# EAGLE design out8_16A_mi_1_0 (EAGLE 5.04)
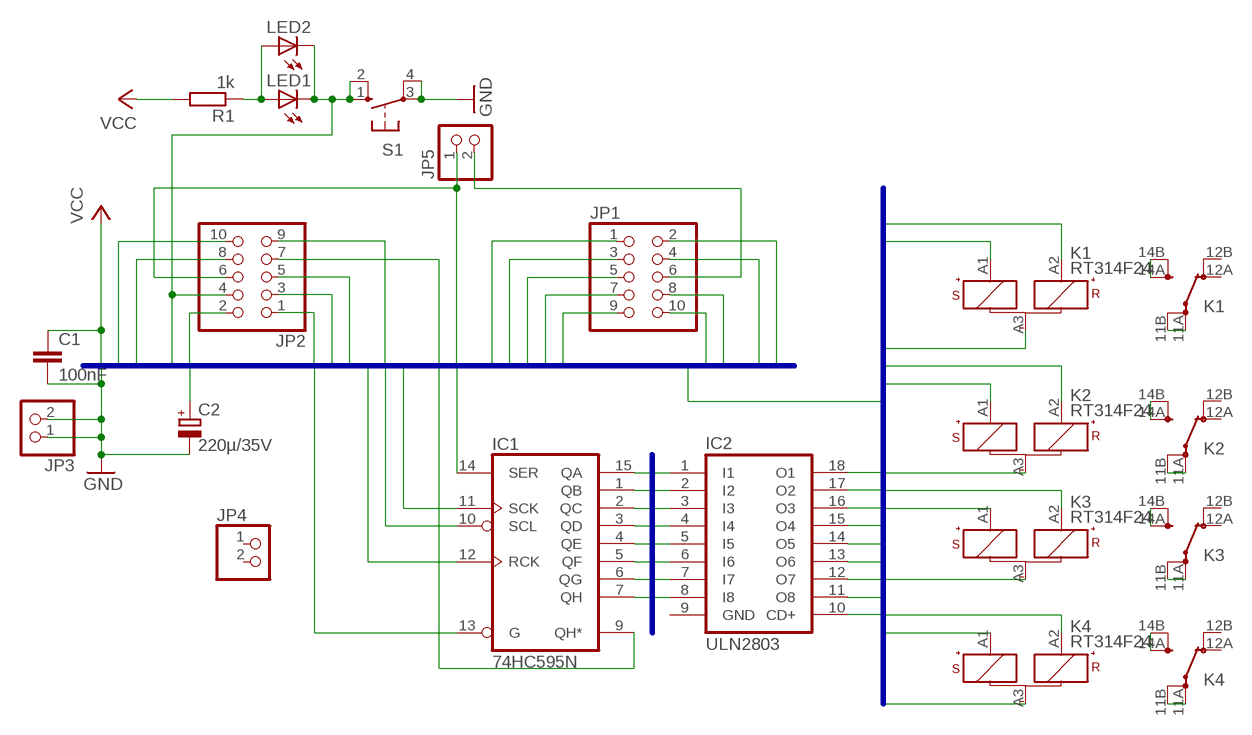
[diagram p0: schematic, sheet 1]

## Parts
C1  100nF  C-EU050-024X044  [C050-024X044]
C2  220µ/35V  CPOL-EUE5-10.5  [E5-10,5]
IC1  74HC595N  [DIL16]
IC2  ULN2803  ULN2803A  [DIL18]
JP1  PINHD-2X5  [2X05]
JP2  PINHD-2X5  [2X05]
JP3  PINHD-1X2  [1X02]
JP4  PINHD-1X2  [1X02]
JP5  PINHD-1X2  [1X02]
K1  RT314F24  [RT1-BI]
K2  RT314F24  [RT1-BI]
K3  RT314F24  [RT1-BI]
K4  RT314F24  [RT1-BI]
LED1  LED3MM  [LED3MM]
LED2  LEDCHIPLED_1206  [CHIPLED_1206]
R1  1k  R-EU_0207/7  [0207/7]
S1  10-XX  [B3F-10XX]

## Nets
CTRL: IC1.13(G) JP1.3 JP2.3
EIB+: JP1.1 JP2.1
GND: C1.2 C2.- JP1.2 JP2.2 JP3.1 JP3.2 S1.3(P) S1.4(P1)
IO0: IC1.14(SER) JP1.7
IO1: JP1.8 JP2.8
IO2: IC1.12(RCK) JP1.9 JP2.9
IO3: IC1.11(SCK) JP1.10 JP2.10
N$1: K1.14A(2:SA) K1.14B(2:SB)
N$2: K1.11A(2:PA) K1.11B(2:PB)
N$11: K2.14A(2:SA) K2.14B(2:SB)
N$12: K2.11A(2:PA) K2.11B(2:PB)
N$18: K3.14A(2:SA) K3.14B(2:SB)
N$19: K3.11A(2:PA) K3.11B(2:PB)
N$20: K4.14A(2:SA) K4.14B(2:SB)
N$21: K4.11A(2:PA) K4.11B(2:PB)
N$30: LED1.A LED2.A R1.1
N$38: IC1.9(QH*) JP2.7
O1: IC2.18(O1) K2.A1(1:S+)
O2: IC2.17(O2) K2.A2(1:R+)
O3: IC2.16(O3) K1.A1(1:S+)
O4: IC2.15(O4) K1.A2(1:R+)
O5: IC2.14(O5) K4.A1(1:S+)
O6: IC2.13(O6) K4.A2(1:R+)
O7: IC2.12(O7) K3.A1(1:S+)
O8: IC2.11(O8) K3.A2(1:R+)
PARSEROUT0: IC1.7(QH) IC2.1(I1)
PARSEROUT1: IC1.6(QG) IC2.2(I2)
PARSEROUT2: IC1.5(QF) IC2.3(I3)
PARSEROUT3: IC1.4(QE) IC2.4(I4)
PARSEROUT4: IC1.3(QD) IC2.5(I5)
PARSEROUT5: IC1.2(QC) IC2.6(I6)
PARSEROUT6: IC1.1(QB) IC2.7(I7)
PARSEROUT7: IC1.15(QA) IC2.8(I8)
PROG: JP1.4 JP2.4 LED1.K(C) LED2.C S1.1(S) S1.2(S1)
VCC: C1.1 IC1.10(SCL) JP1.5 JP2.5 R1.2
VERS: C2.+ IC2.10(CD+) JP2.6 JP5.1 K1.A3(1:-) K2.A3(1:-) K3.A3(1:-) K4.A3(1:-)
VERS_CONTR: JP1.6 JP5.2
Unconnected: JP4.1 JP4.2 K1.12A(2:OA) K1.12B(2:OB) K2.12A(2:OA) K2.12B(2:OB) K3.12A(2:OA) K3.12B(2:OB) K4.12A(2:OA) K4.12B(2:OB)

## Buses
EIB+,GND,CTRL,PROG,VCC,VERS,IO[0..3]
PARSEROUT[0..7]
O[1..8],VERS

## Power pins joined to a net without a drawn wire
GND: IC1.8(GND) IC2.9(GND)
VCC: IC1.16(VCC)

## Library data of the parts
C1 = rcl:C-EU: CAPACITOR, European symbol
C2 = rcl:CPOL-EU: POLARIZED CAPACITOR, European symbol
IC1 = 74xx-eu:74*595: 8-bit SHIFT REGISTER, output latch
IC2 = uln-udn:ULN2803A: DRIVER ARRAY
JP1 JP2 = pinhead:PINHD-2X5: PIN HEADER
JP3-JP5 = pinhead:PINHD-1X2: PIN HEADER
K1-K4 = relay:RT?F*: Power PCB Relay SCHRACK bistable 1 pole 16 A, polarized bistable version Source: http://www.schrack.com/.. 5821.pdf
LED1 LED2 = led:LED: LED OSRAM: - CHIPLED LG R971, LG N971, LY N971, LG Q971, LY Q971, LO R971, LY R971 LH N974, LH R974 LS Q976, LO Q976, LY Q976 LO Q996 - Hyper CHIPLED LW Q18S LB Q993, LB Q99A, LB R99A - SideLED LS A670, LO A670, LY A670, LG A670, LP A670 LB A673, LV A673, LT A673, LW A673 LH A674 LY A675 LS A676, LA A676, LO A676, LY A676, LW A676 LS A679, LY A679, LG A679 - Hyper Micro SIDELED® LS Y876, LA Y876, LO Y876, LY Y876 LT Y87S - SmartLED LW L88C, LW L88S LB L89C, LB L89S, LG L890 LS L89K, LO L89K, LY L89K LS L896, LA L896, LO L896, LY L896 - TOPLED LS T670, LO T670, LY T670, LG T670, LP T670 LSG T670, LSP T670, LSY T670, LOP T670, LYG T670 LG T671, LOG T671, LSG T671 LB T673, LV T673, LT T673, LW T673 LH T674 LS T676, LA T676, LO T676, LY T676, LB T676, LH T676, LSB T676, LW T676 LB T67C, LV T67C, LT T67C, LS T67K, LO T67K, LY T67K, LW E67C LS E67B, LA E67B, LO E67B, LY E67B, LB E67C, LV E67C, LT E67C LW T67C LS T679, LY T679, LG T679 LS T770, LO T770, LY T770, LG T770, LP T770 LB T773, LV T773, LT T773, LW T773 LH T774 LS E675, LA E675, LY E675, LS T675 LS T776, LA T776, LO T776, LY T776, LB T776 LHGB T686 LT T68C, LB T68C - Hyper Mini TOPLED® LB M676 - Mini TOPLED Santana® LG M470 LS M47K, LO M47K, LY M47K Source: http://www.osram.convergy.de - LUMILED® LXK2-PW12-R00, LXK2-PW12-S00, LXK2-PW14-U00, LXK2-PW14-V00 LXK2-PM12-R00, LXK2-PM12-S00, LXK2-PM14-U00 LXK2-PE12-Q00, LXK2-PE12-R00, LXK2-PE12-S00, LXK2-PE14-T00, LXK2-PE14-U00 LXK2-PB12-K00, LXK2-PB12-L00, LXK2-PB12-M00, LXK2-PB14-N00, LXK2-PB14-P00, LXK2-PB14-Q00 LXK2-PR12-L00, LXK2-PR12-M00, LXK2-PR14-Q00, LXK2-PR14-R00 LXK2-PD12-Q00, LXK2-PD12-R00, LXK2-PD12-S00 LXK2-PH12-R00, LXK2-PH12-S00 LXK2-PL12-P00, LXK2-PL12-Q00, LXK2-PL12-R00 Source: www.luxeon.com
R1 = rcl:R-EU_: RESISTOR, European symbol
S1 = switch-omron:10-XX: OMRON SWITCH

## Board
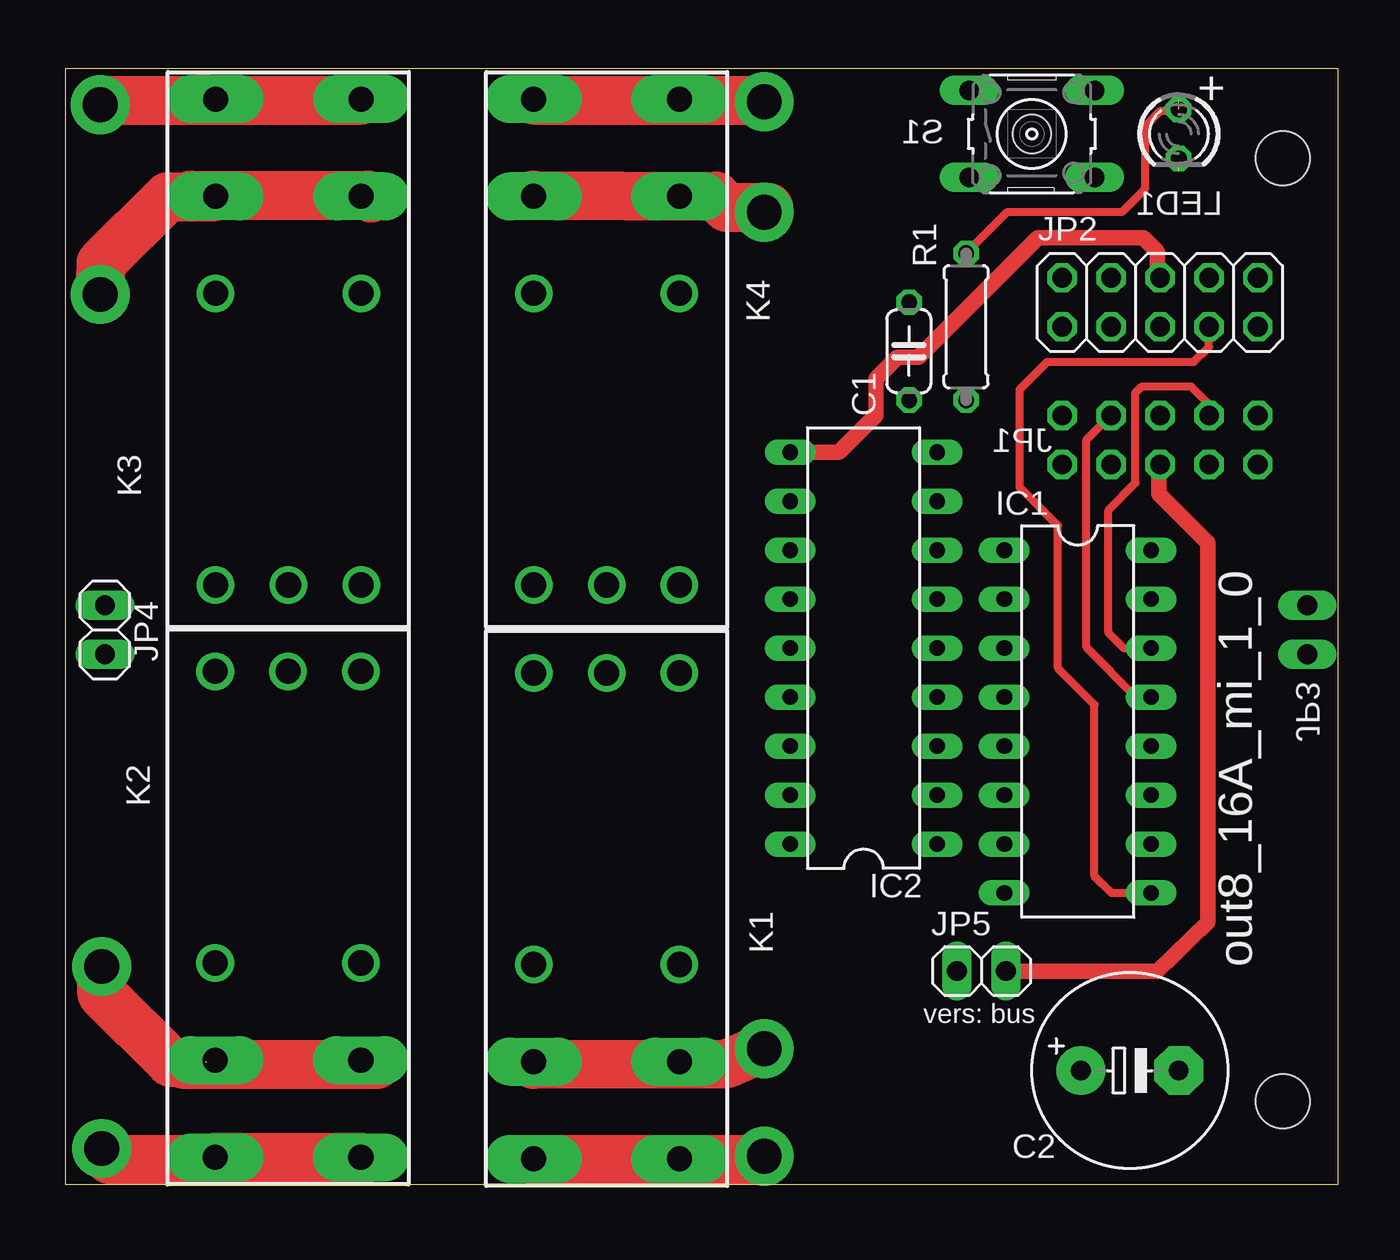
[diagram p1: board, top side]
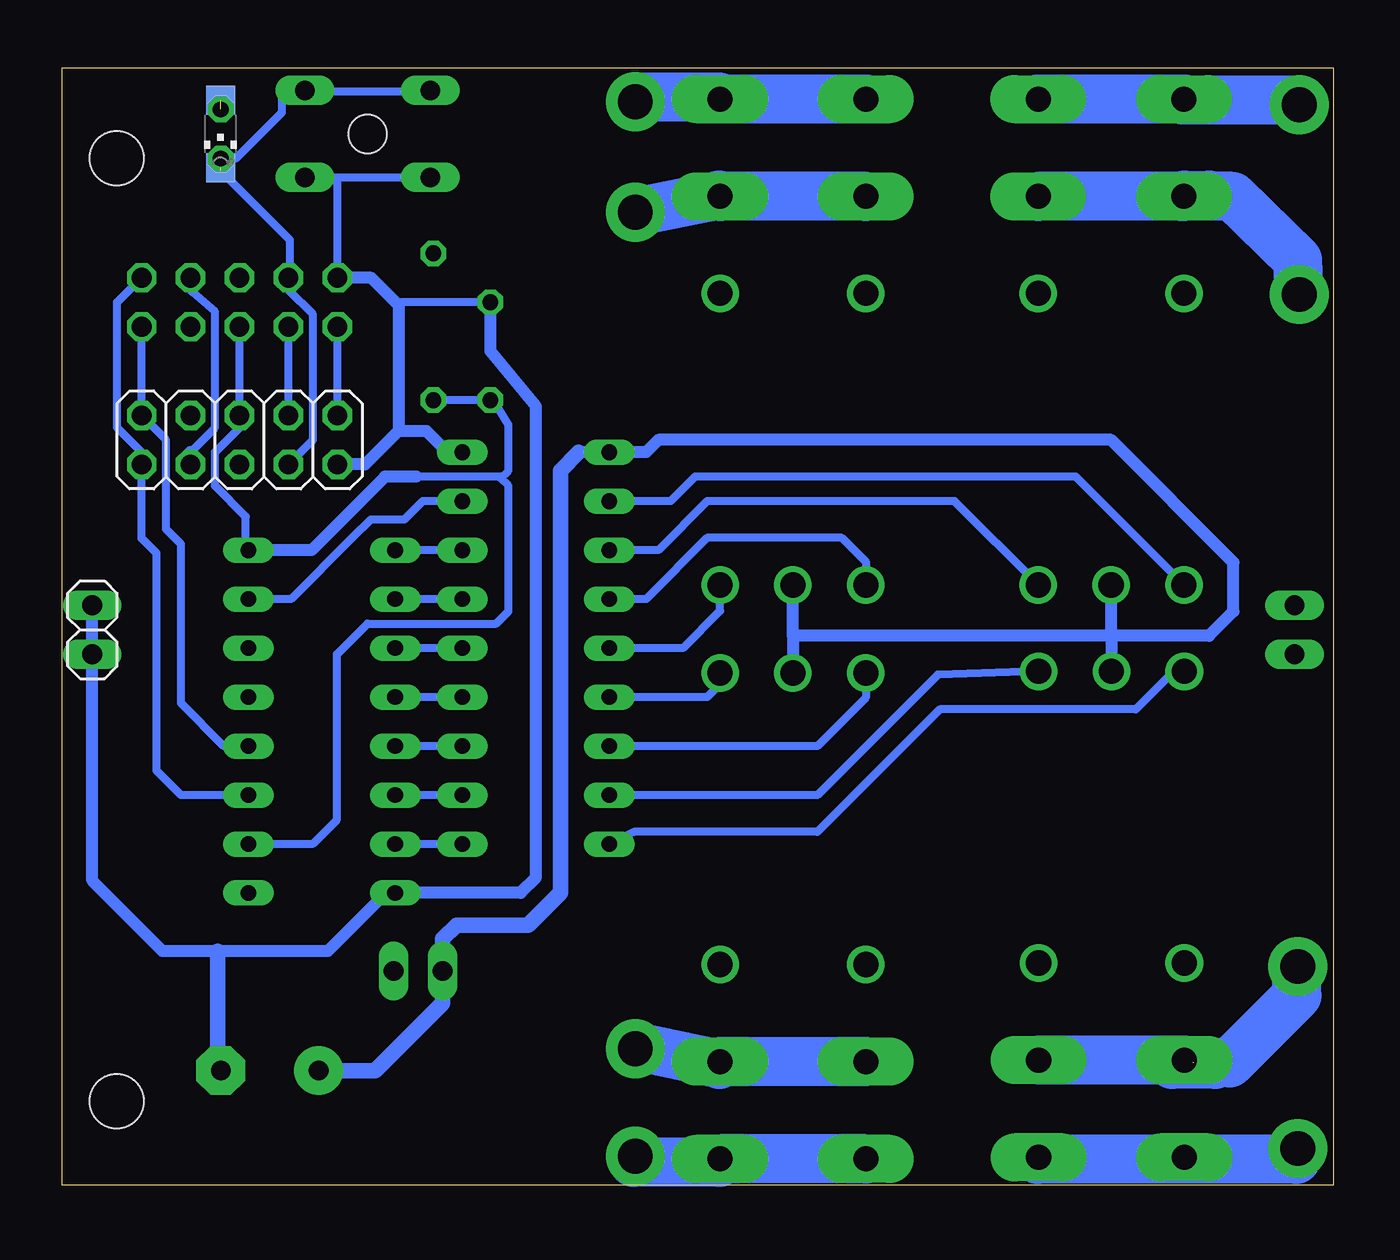
[diagram p2: board, bottom side, seen from below]

Size 66 x 57.9 mm. Coordinates in mm from the lower left corner, seen from the top.
Outline: 0,57.9 66,57.9 66,0 0,0 0,57.9
Copper layers (1*16): Top 0.035mm / dielectric 1.5mm / Bottom 0.035mm
Design rules "default": minimum track width 10mil, minimum drill 24mil, track to track 8mil, track to pad 8mil, pad to pad 8mil, via to via 8mil, smd to smd 8mil, copper to edge 40mil, drill to drill 8mil, minimum pad ring 10mil, minimum via ring 8mil, stop-mask expansion 4mil, vias tented up to drill 0mil, thermal gap 10mil
Holes 2.8 mm at 63.13,4.34 63.13,53.24
Holes 2 mm at 50.12,54.51
tKeepout: area 61.1,2.3 to 65.1,6.3; area 61.1,51.2 to 65.1,55.2
bKeepout: area 61.1,2.3 to 65.1,6.3; area 61.1,51.2 to 65.1,55.2; area 39,1.9 to 44,6.9

### Footprints (pad centres in the part's own frame; a part is rotated, then mirrored left to right if it is on the bottom)
C050-024X044 = drill 0.813 octagon: 1 -2.54,0; 2 2.54,0
E5-10,5 = drill 1.016 pad 2.54 round: + -2.54,0 | drill 1.016 pad 2.54 octagon: - 2.54,0
DIL16 = drill 0.813 long: 1 -8.89,-3.81; 2 -6.35,-3.81; 3 -3.81,-3.81; 4 -1.27,-3.81; 5 1.27,-3.81; 6 3.81,-3.81; 7 6.35,-3.81; 8 8.89,-3.81; 9 8.89,3.81; 10 6.35,3.81; 11 3.81,3.81; 12 1.27,3.81; 13 -1.27,3.81; 14 -3.81,3.81; 15 -6.35,3.81; 16 -8.89,3.81
DIL18 = drill 0.813 long: 1 -10.16,-3.81; 2 -7.62,-3.81; 3 -5.08,-3.81; 4 -2.54,-3.81; 5 0,-3.81; 6 2.54,-3.81; 7 5.08,-3.81; 8 7.62,-3.81; 9 10.16,-3.81; 10 10.16,3.81; 11 7.62,3.81; 12 5.08,3.81; 13 2.54,3.81; 14 0,3.81; 15 -2.54,3.81; 16 -5.08,3.81; 17 -7.62,3.81; 18 -10.16,3.81
2X05 = drill 1.016 octagon: 1 -5.08,-1.27; 2 -5.08,1.27; 3 -2.54,-1.27; 4 -2.54,1.27; 5 0,-1.27; 6 0,1.27; 7 2.54,-1.27; 8 2.54,1.27; 9 5.08,-1.27; 10 5.08,1.27
1X02 = drill 1.016 long: 1 -1.27,0; 2 1.27,0
RT1-BI = drill 1.3 pad 2.5 long: 11A 7.56,3.78; 11B 7.56,-3.78; 14A 12.6,3.78; 14B 12.6,-3.78 | drill 1.3 round: 12A 2.52,3.78; 12B 2.52,-3.78; A1 -12.6,-3.78; A2 -12.6,3.78; A3 -12.6,0
LED3MM = drill 0.813 octagon: A -1.27,0; K 1.27,0
CHIPLED_1206 = smd 1.5 x 1.5: A 0,-1.75; C 0,1.75
0207/7 = drill 0.813 octagon: 1 -3.81,0; 2 3.81,0
B3F-10XX = drill 1.016 long: 1 -3.251,2.261; 2 3.251,2.261; 3 -3.251,-2.261; 4 3.251,-2.261

### Placement (x,y rotation side)
C1  43.74,43.24 90 top
C2  55.2,5.93 0 top
IC1  52.5,24.03 270 top
IC2  41.39,27.84 90 top
JP1  56.76,38.63 180 bottom
JP2  56.76,45.78 0 top
JP3  64.41,28.79 90 bottom
JP4  2.02,28.79 90 top
JP5  47.5,11.09 0 top
K1  28.05,13.95 270 top
K2  11.52,14.03 270 top
K3  11.54,43.71 90 top
K4  28.05,43.71 90 top
LED1  57.74,54.51 270 top
LED2  57.75,54.51 180 bottom
R1  46.7,44.51 270 top
S1  50.12,54.51 0 top

### Tracks (layer width: path | path; a pad name or v marks a point on that pad's centre or on a via)
CTRL
  Top 0.406: IC1.13 55.51,25.3 52.95,27.89 52.95,38.65 JP1.3
  Bottom 0.406: JP1.3 JP2.3
EIB+
  Bottom 0.406: JP1.1 JP2.1
GND
  Bottom 0.406: 52,52.25 S1.3 | 52,52.25 S1.4 | JP2.2 51.68,51.93 52,52.25 | C1.2 48.35,45.78 48.51,45.62
  Bottom 0.61: IC1.8 42.18,15.14 41.39,15.93 41.39,40.38 43.74,43.24 C1.2 | IC1.8 | JP1.2 50.25,37.36 48.51,39.11 | IC1.8 49.16,15.14 52.18,12.12 57.9,12.12 60.75,12.12 64.4,15.77 JP3.1 JP3.2 | 48.51,39.11 48.51,45.62 49.93,47.05 JP2.2 | IC2.9 45.97,38 47.08,39.11 48.51,39.11
  Bottom 0.813: C2.- 57.9,5.93 57.9,12.12
IO0
  Top 0.406: IC1.14 54.88,27.84 54.09,28.63 54.09,34.98 55.49,36.41 55.49,41.09 55.83,41.41 58.37,41.41 59.25,40.54 59.25,39.96 JP1.7
IO1
  Bottom 0.406: 59.3,38 58.03,39.27 58.03,45.28 59.18,46.29 59.3,46.4 JP2.8
  Bottom 0.61: JP1.8 59.3,38
IO2
  Bottom 0.406: JP2.9 JP1.9 60.57,38.63 60.57,34 59.8,33.23 59.8,24.98 57.58,22.76 IC1.12 | IC1.12
IO3
  Bottom 0.406: JP2.10 63.11,45.78 63.11,39.27 61.84,38 JP1.10 61.84,33.53 61.07,32.76 61.07,21.49 59.8,20.22 IC1.11
N$1
  Bottom 2.54: K1.14B K1.14A
N$2
  Bottom 2.54: K1.11B K1.11A
N$3  (via drill 1.8 pad 3.05)
  other vias: 1.86,1.88
N$4  (via drill 1.8 pad 3.05)
  other vias: 1.86,11.33
N$5  (via drill 1.8 pad 3.05)
  other vias: 1.78,46.17
N$6  (via drill 1.8 pad 3.05)
  other vias: 1.78,56.02
N$7  (via drill 1.8 pad 3.05)
  other vias: 36.23,56.17
N$8  (via drill 1.8 pad 3.05)
  Bottom 2.54: 31.86,51.33 v36.24,50.44
N$9  (via drill 1.8 pad 3.05)
  other vias: 36.23,7.06
N$10  (via drill 1.8 pad 3.05)
  other vias: 36.23,1.48
N$11
  Top 2.54: K2.14B K2.14A
N$12
  Bottom 2.54: K2.11B K2.11A
N$18
  Bottom 2.54: K3.14A K3.14B
N$19
  Bottom 2.54: K3.11A K3.11B
N$20
  Bottom 2.54: K4.14A K4.14B
N$21
  Bottom 2.54: K4.11A K4.11B
N$22
  Bottom 2.54: 31.86,6.25 36.31,7.19
N$23
  Bottom 2.54: 31.86,1.17 36.31,1.17
N$24
  Bottom 2.54: 15.35,1.33 1.94,1.33 1.94,2.12
N$25
  Bottom 2.54: 6.14,6.25 8.37,6.25
N$26
  Bottom 2.54: 7.73,51.33 6.46,51.33
N$27
  Bottom 2.54: 7.81,6.33 5.39,6.33 1.9,9.82 1.9,11.41
N$28
  Bottom 2.54: 31.86,56.41 36.31,56.41
N$29
  Top 2.54: 7.1,56.33 7.73,56.25 7.81,56.25 | 7.81,56.25 15.35,56.25 | 7.81,56.25 1.94,56.25 1.62,55.94
N$30  (1 unrouted)
  Top 0.406: R1.1 48.85,50.46 54.8,50.46 55.99,51.65 55.99,54.9 56.78,55.7 57.66,55.7 LED1.A
N$31
  Top 2.54: 24.24,56.25 36.15,56.25 36.31,56.41
N$32
  Top 2.54: 24.24,51.33 33.7,51.28 34.28,50.7 36.46,50.7
N$33
  Top 2.54: 6.46,51.33 15.67,51.33 15.83,51.17
N$34
  Bottom 2.54: 7.89,51.26 5.25,51.26 1.86,47.96 1.78,46.17
N$35
  Top 2.54: 6.14,6.25 16.14,6.25
N$36
  Top 2.54: 24.24,6.25 34.31,6.29 36.24,7.14
N$37
  Top 2.54: 24.16,1.33 36.07,1.33
N$38
  Top 0.406: JP2.7 59.3,43.45 58.53,42.68 50.91,42.68 49.48,41.25 49.48,36.17 51.47,34.19 51.47,26.8 53.37,24.9 53.37,16.01 54.24,15.14 IC1.9 | IC1.9
N$39
  Bottom 2.54: 7.81,56.25 2.18,56.25 1.86,55.94
N$40
  Top 2.54: 7.73,51.25 5.29,51.25 1.83,47.82 1.78,46.17
N$41  (1 unrouted)
  Top 0.406: 7.25,6.09 7.25,6.37 7.31,6.43 7.32,6.43 7.36,6.39 7.4,6.39 7.4,6.34 7.36,6.3
  Top 2.54: 1.86,11.25 1.86,9.91 5.42,6.35 7.31,6.35
N$42
  Top 2.54: 15.27,1.25 15.19,1.33 2.25,1.33 1.62,1.96
O1
  Bottom 0.406: K2.A1 8.47,26.47 10.27,24.66 20.43,24.66 26.78,18.31 36.31,18.31 IC2.18
O2
  Bottom 0.406: K2.A2 20.53,26.47 26.78,20.22 IC2.17
O3
  Bottom 0.406: K1.A1 24.27,25.27 26.78,22.76 IC2.16
O4
  Bottom 0.406: K1.A2 31.83,25.96 32.5,25.3 IC2.15
O5
  Bottom 0.406: K4.A1 31.83,29.77 33.77,27.84 IC2.14
O6
  Bottom 0.406: IC2.13 35.67,30.38 32.5,33.55 25.51,33.55 24.24,32.28 24.24,31.14 K4.A2
O7
  Bottom 0.406: IC2.12 35.04,32.92 32.5,35.46 19.67,35.46 K3.A1
O8
  Bottom 0.406: IC2.11 34.4,35.46 33.13,36.73 13.38,36.73 K3.A2
PARSEROUT0
  Bottom 0.406: IC2.1 IC1.7 | IC1.7
PARSEROUT1
  Bottom 0.406: IC1.6 47.42,20.22 45.99,20.22 IC2.2
PARSEROUT2
  Bottom 0.406: IC1.5 47.42,22.76 45.99,22.76 IC2.3
PARSEROUT3
  Bottom 0.406: IC2.4 IC1.4 | IC1.4
PARSEROUT4
  Bottom 0.406: IC1.3 47.42,27.84 45.99,27.84 IC2.5
PARSEROUT5
  Bottom 0.406: IC1.2 47.42,30.38 45.99,30.38 IC2.6
PARSEROUT6
  Bottom 0.406: IC1.1 47.42,32.92 45.99,32.92 IC2.7
PARSEROUT7
  Bottom 0.406: IC2.8 47.26,35.46 48.21,34.5 49.96,34.5 50.91,33.55 54.09,30.38 IC1.15 | IC1.15
PROG  (1 unrouted)
  Bottom 0.406: JP1.4 52.95,38.63 52.95,45.14 54.22,46.41 JP2.4 54.14,47.13 54.14,49 57.74,52.6 57.74,53.16 57.7,53.2 LED1.K 56.94,53.24 54.56,55.62 54.56,56.69 S1.2 53.01,56.77 52.97,56.73 48.17,56.73 S1.1
VCC
  Bottom 0.406: JP2.5 JP1.5 56.76,39.27 58.03,38 58.03,36.25 56.44,34.66 56.44,32.92 IC1.16 | 43.21,36.65 42.82,36.25 42.82,29.74 43.45,29.11 50.12,29.11 51.71,27.52 51.71,18.95 52.97,17.68 IC1.10 | 43.21,36.65 43.29,36.73 47.58,36.73 | 43.21,36.65 42.82,37.04 42.82,39.43 43.59,40.7 C1.1 46.07,40.7 R1.2
  Bottom 0.61: IC1.16 53.03,32.92 49.22,36.73 47.58,36.73 | IC1.16 | IC1.10
VERS
  Top 0.813: JP2.6 56.63,47.18 56.63,48.39 55.91,49.11 50.43,49.11 44.24,42.92 43.13,42.92 42.02,41.81 42.02,39.9 40.12,38 IC2.10
  Bottom 0.61: 28.05,28.47 K4.A3 | 28.05,28.47 K1.A3 | 11.54,28.47 K3.A3 | 11.54,28.47 28.05,28.47 | 11.54,28.47 K2.A3 | 11.54,28.47 6.46,28.47 5.19,29.74 5.19,32.28 11.54,38.63 35.04,38.63 35.67,38 IC2.10 39.16,38
  Bottom 0.813: 39.16,38 40.12,37.04 40.12,15.14 41.78,13.47 45.51,13.47 46.23,12.76 JP5.1 | JP5.1 | JP5.1 46.23,9.42 49.72,5.93 C2.+
VERS_CONTR
  Top 0.813: JP1.6 56.71,37.31 56.71,35.85 59.25,33.31 59.25,13.63 56.63,11.09 JP5.2

### Text on the board
tPlace: + | out8_16A_mi_1_0 | vers: bus